# EasyEDA Pro project ProPrj_trevorschirmer-relayboard_2025-04-09.epro, board PCB_1
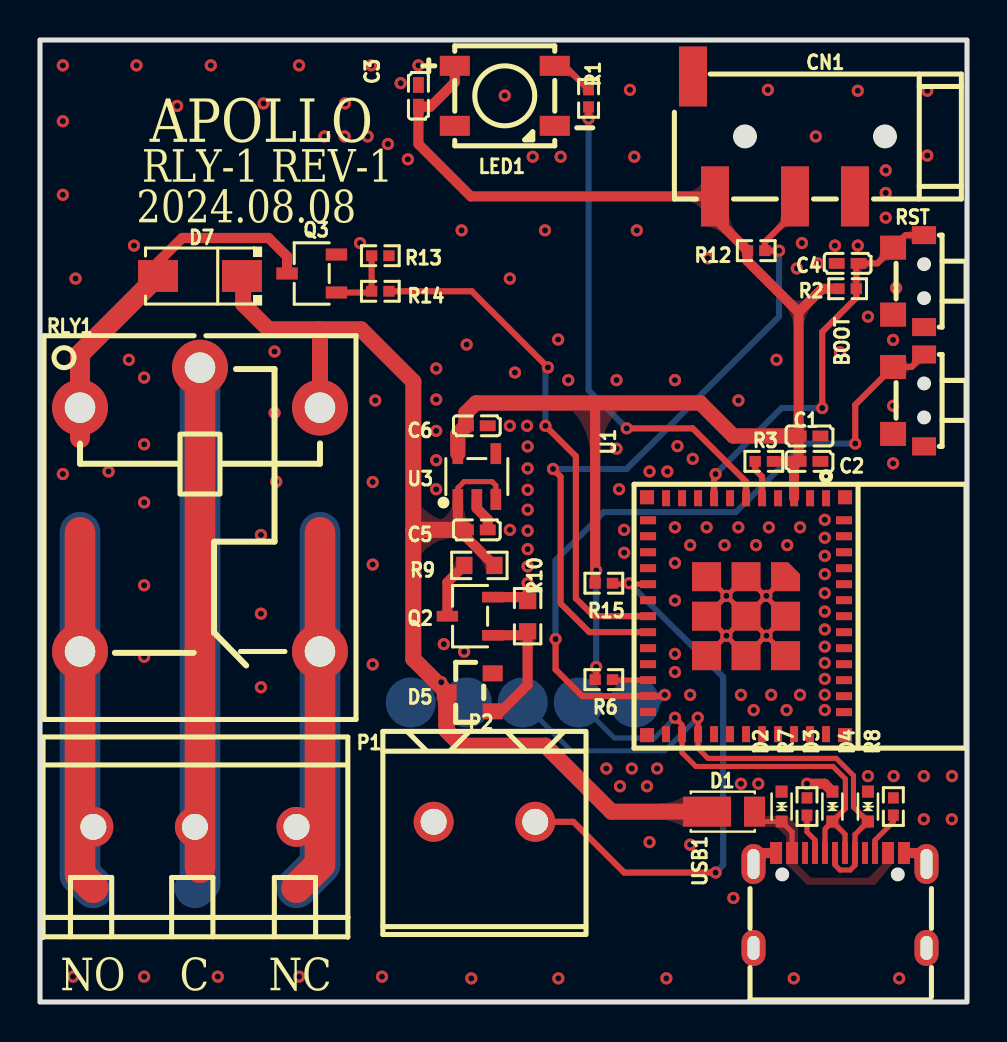
[diagram p10: board, top side]
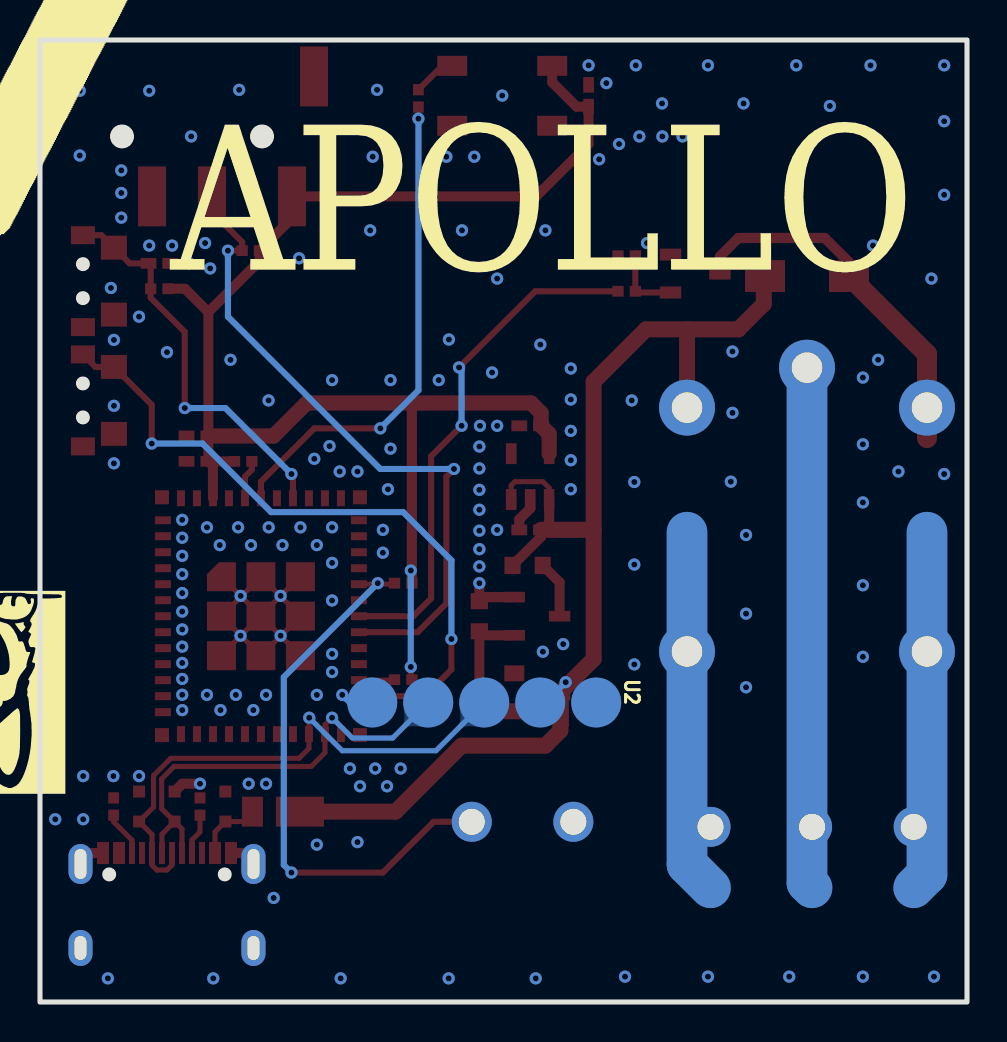
[diagram p11: board, bottom side, seen from below]

Outline 46.36 x 48.13 mm; copper layers: Top Layer, Bottom Layer. Coordinates in mm from the lower left corner of the outline.
Outline path: rectangle 0,48.13 46.36,0
Stack: Top Layer 0.035mm / Dielectric1 1.51mm FR4 er 4.5 / Bottom Layer 0.035mm

## Design rules (mm)
net IO_USBD-: DP1
net IO_USBD+: DP1
template: JLCPCB Capability(Two Layers Board)
spacing copperThickness1oz (default): track to track 0.102, other pairs 0.152 to 0.3
spacing copperThickness2oz: track to track 0.203, other pairs 0.152 to 0.3
track width copperThickness1oz (default): min 0.127, default 0.254, max 2.54
track width copperThickness2oz: min 0.203, default 0.254, max 2.54
differential pair differentialPair (default): width min 0.127, default 0.254, max 2.54; gap min 0.152, default 0.152
via viaSize (default): diameter min 0.5, default 0.61, max 10; hole min 0.3, default 0.305, max 6.3

## Placement (name value [footprint] x y rotation side)
BOOT  TS24CA  [SW-SMD_TS24CA]  43.43 30.1 270 top
C1  10uF  [C0402]  38.48 28.32 180 top
C2  100nF  [C0402]  38.48 27.05 0 top
C3  100nF  [C0402]  18.92 45.34 270 top
C4  1uF  [C0402]  40.39 36.96 0 top
C5  10uF  [C0402]  21.84 23.62 180 top
C6  10uF  [C0402]  21.84 28.83 180 top
CN1  PJ-320D  [AUDIO-SMD_PJ-320D]  36.7 43.31 270 top
D1  DFLS130L-7  [POWERDI-123_L2.8-W1.8-LS3.7-RD]  34.54 9.52 0 top
D2  LESD5D5.0CT1G  [SOD-523_L1.2-W0.8-LS1.6-BI]  37.08 9.78 90 top
D3  LESD5D5.0CT1G  [SOD-523_L1.2-W0.8-LS1.6-BI]  39.62 9.78 90 top
D4  LESD5D5.0CT1G  [SOD-523_L1.2-W0.8-LS1.6-BI]  41.4 9.78 90 top
D5  BZX84C6V8  [SOT-23_L2.9-W1.3-P1.90-LS2.4-BR]  21.49 15.49 0 top
D7  1N4007  [SMA_L4.3-W2.5-LS5.0-RD]  8 36.32 180 top
LED1  XL-5050RGBC-WS2812B  [LED-SMD_4P-L5.0-W5.0-BL_XL-5050RGBC]  23.24 45.34 270 top
P1  WJ500V-5.08-3P  [CONN-TH_3P-P5.00_WJ500V-5.08-3P]  7.75 8.76 0 top
P2  WJ500V-5.08-2P  [CONN-TH_2P-P5.00_WJ500V-5.08-2P]  22.23 9.02 180 top
Q2  BC817  [SOT-23-3_L2.9-W1.4-P1.91-LS2.6-BR]  21.51 19.3 0 top
Q3  S8050-J3Y  [SOT-23-3_L2.9-W1.6-P1.90-LS2.8-BR]  13.59 36.45 0 top
R1  470Ω  [R0402]  27.43 45.21 270 top
R2  10kΩ  [R0402]  40.39 35.69 180 top
R3  100kΩ  [R0402]  36.2 27.05 0 top
R6  10kΩ  [R0402]  28.19 16.13 180 top
R7  5.1kΩ  [R0402]  38.35 9.78 270 top
R8  5.1kΩ  [R0402]  42.67 9.78 270 top
R9  10K  [R0603]  21.97 21.84 0 top
R10  10K  [R0603]  24.38 19.3 270 top
R12  4.7kΩ  [R0402]  35.81 37.59 180 top
R13  470Ω  [R0402]  17.02 35.56 180 top
R14  10kΩ  [R0402]  17.02 37.34 180 top
R15  10kΩ  [R0402]  28.19 20.95 180 top
RLY1  SRD-05VDC-SL-C  [RELAY-TH_SRD-XXVDC-XL-C]  8 24.64 270 top
RST  TS24CA  [SW-SMD_TS24CA]  43.43 36.07 270 top
U1  ESP32-C3-MINI-1-N4  [WIFIM-SMD_ESP32-C3-MINI-1]  35.31 19.3 270 top
U2  -  [Programming Pads]  18.54 14.99 270 bottom
U3  RT9080-33GJ5  [TSOT-23-5_L2.9-W1.6-P0.95-LS2.8-BL]  21.84 26.29 0 top
USB1  TYPE-C16PIN2MD(073)  [USB-C-SMD_TYPE-C-6PIN-2MD-073]  40.01 5.08 0 top

## Footprints (pads in the part's own frame, mm; a bottom-side part is the same pattern mirrored in y, then rotated)
AUDIO-SMD_PJ-320D
  rect 3x1.4 smd: 1(-3,-4.05) 2(3,4.05) 3(3,1.05) 4(3,-2.95)
C0402
  rect 0.79x0.54 smd: 1(-0.545,0) 2(0.545,0)
CONN-TH_2P-P5.00_WJ500V-5.08-2P
  round 2 hole 1.3: 1(-2.54,0) 2(2.54,0)
CONN-TH_3P-P5.00_WJ500V-5.08-3P
  round 2 hole 1.3: 1(-5.08,0) 2(0,0) 3(5.08,0)
LED-SMD_4P-L5.0-W5.0-BL_XL-5050RGBC
  rect 1x1.5 smd: 1(-1.5,-2.5) 2(1.5,-2.5) 3(1.5,2.5) 4(-1.5,2.5)
POWERDI-123_L2.8-W1.8-LS3.7-RD
  rect 2.4x1.5 smd: 1(-1.188,0)
  rect 1.05x1.5 smd: 2(1.188,0)
Programming Pads
  round 2.5 smd: 1(0,0) 2(0,-2.8) 3(0,-5.6) 4(0,-8.4) 5(0,-11.2)
R0402
  rect 0.566x0.54 smd: 1(-0.433,0) 2(0.433,0)
R0603
  rect 0.806x0.864 smd: 1(-0.753,0) 2(0.753,0)
RELAY-TH_SRD-XXVDC-XL-C
  round 2.794 hole 1.524: 1(-5.1,-6) 2(7.1,-6) 3(7.1,6) 4(-5.1,6) 5(-7.1,0)
SMA_L4.3-W2.5-LS5.0-RD
  rect 2x1.593 smd: 1(-2.1,0) 2(2.1,0)
SOD-523_L1.2-W0.8-LS1.6-BI
  rect 0.6x0.6 smd: 1(-0.75,0) 2(0.75,0)
SOT-23-3_L2.9-W1.4-P1.91-LS2.6-BR
  rect 1.07x0.532 smd: 1(1.135,-0.955) 2(1.135,0.955) 3(-1.135,0)
SOT-23-3_L2.9-W1.6-P1.90-LS2.8-BR
  rect 1.07x0.6 smd: 1(1.235,-0.95) 2(1.235,0.95) 3(-1.235,0)
SOT-23_L2.9-W1.3-P1.90-LS2.4-BR
  rect 1x0.8 smd: 1(1.15,-0.95) 2(1.15,0.95) 3(-1.15,0)
SW-SMD_TS24CA
  rect 0.9x1.2 smd: 1(-2.3,0.775) 2(2.3,0.775)
  rect 1.2x1.3 smd: 3(-1.675,-0.775) 4(1.675,-0.775)
TSOT-23-5_L2.9-W1.6-P0.95-LS2.8-BL
  rect 0.532x1.045 smd: 1(-0.95,-1.147) 2(0,-1.147) 3(0.95,-1.147) 4(0.95,1.147) 5(-0.95,1.147)
USB-C-SMD_TYPE-C-6PIN-2MD-073
  rect 0.6x1.1 smd: 1(-3.2,2.375) 2(-2.4,2.375) 11(2.4,2.375) 12(3.2,2.375)
  rect 0.3x1.1 smd: 3(-1.75,2.375) 4(-1.25,2.375) 5(-0.75,2.375) 6(-0.25,2.375) 7(0.25,2.375) 8(0.75,2.375) 9(1.25,2.375) 10(1.75,2.375)
  oval 1.2x2 hole 0.6x1.5: 13(-4.325,1.825) 14(4.325,1.825)
  oval 1.2x1.8 hole 0.6x1.2: 13(-4.325,-2.375) 14(4.325,-2.375)
WIFIM-SMD_ESP32-C3-MINI-1
  rect 0.8x0.4 smd: 1(-5.9,4) 2(-5.9,3.2) 3(-5.9,2.4) 4(-5.9,1.6) 5(-5.9,0.8) 6(-5.9,0) 7(-5.9,-0.8) 8(-5.9,-1.6) 9(-5.9,-2.4) 10(-5.9,-3.2) 11(-5.9,-4) 25(5.9,-4) 26(5.9,-3.2) 27(5.9,-2.4) 28(5.9,-1.6) 29(5.9,-0.8) 30(5.9,0) 31(5.9,0.8) 32(5.9,1.6) 33(5.9,2.4) 34(5.9,3.2) 35(5.9,4)
  rect 0.4x0.8 smd: 12(-4.8,-4.9) 13(-4,-4.9) 14(-3.2,-4.9) 15(-2.4,-4.9) 16(-1.6,-4.9) 17(-0.8,-4.9) 18(0,-4.9) 19(0.8,-4.9) 20(1.6,-4.9) 21(2.4,-4.9) 22(3.2,-4.9) 23(4,-4.9) 24(4.8,-4.9) 36(4.8,4.9) 37(4,4.9) 38(3.2,4.9) 39(2.4,4.9) 40(1.6,4.9) 41(0.8,4.9) 42(0,4.9) 43(-0.8,4.9) 44(-1.6,4.9) 45(-2.4,4.9) 46(-3.2,4.9) 47(-4,4.9) 48(-4.8,4.9)
  custom 1.45x1.45 smd: 49(-1.975,1.975)
  rect 1.45x1.45 smd: 49(-1.975,0) 49(-1.975,-1.975) 49(0,1.975) 49(0,0) 49(0,-1.975) 49(1.975,1.975) 49(1.975,0) 49(1.975,-1.975)
  rect 0.7x0.7 smd: 50(5.95,4.95) 51(5.95,-4.95) 52(-5.95,-4.95) 53(-5.95,4.95)

## Nets
As in the schematic.

Pads without a net: BOOT 2; CN1 1; D5 2; LED1 2; RST 2; U1 4 7 9 10 12 13 15 17 20 21 24 25 28 29 30 31 32 33 34 35; U3 4; USB1 3 9

## Via types
v1: diameter 0.61, hole 0.305, Top Layer to Bottom Layer, 181 vias

## Routing (per net, layer and track width the routed paths; a pad name or vN(x,y) marks a point on that pad's centre or on a via; arc(x,y) is an arc through that point)
+3V3: length 76.6
  Top Layer w0.305: R6.2 27.81,16.18 v1(27.81,16.76) ; R15.2 27.81,21.01 v1(27.81,21.59)
  Top Layer w0.5: U1.3 37.71,26.82 C2.1 ; R3.2 C2.1 ; C2.1 C1.2 37.94,34.52 ; LED1.1 20.74,46.01 19.52,44.79 C3.2 18.92,42.93 21.54,40.31 CN1.4 33.75,39.22 R12.2 35.38,37.07 37.94,34.52 ; 37.94,34.52 39.11,35.69 R2.2
  Top Layer w0.508: R15.2 27.76,29.86 27.65,29.97
  Top Layer w0.762: 20.89,27.44 20.89,28.42 C6.2 21.3,29.47 21.8,29.97 33.02,29.97 34.67,28.32 C1.2
  Bottom Layer w0.305: v1(27.81,21.59) v1(27.81,16.76)
+5V_USB: length 62.6
  Top Layer w0.254: U3.3 22.79,25.85 22.61,26.03 21.21,26.03 20.89,25.72 20.89,25.14
  Top Layer w0.305: v1(20.07,16) 20.07,13.84 20.34,13.57
  Top Layer w0.5: R9.2 21.3,23.27 C5.2 ; 20.79,23.62 20.89,23.73 20.89,25.14
  Top Layer w0.8: 10.16,36.19 10.16,34.92 11.43,33.66 13.95,33.66 ; C5.2 18.67,23.62 ; 18.67,23.62 18.67,31.04 16.05,33.66 13.95,33.66 ; 18.67,23.62 18.67,17.16 D5.3 20.34,13.57 21.08,12.83 25.27,12.83 28.58,9.52 D1.1 ; RLY1.4 14,33.6 13.95,33.66 ; 10.16,36.26 D7.1
  Top Layer w1: 10.16,36.19 10.16,36.32
  Bottom Layer w0.305: U2.2 21.08,14.99 v1(20.07,16)
GND: length 31
  Top Layer w0.254: U1.49 34.32,18.32 ; U1.49 35.32,19.32 ; U1.49 35.31,19.34 ; 34.32,18.32 U1.49 ; 34.32,18.32 U1.49 36.31,18.33 ; 34.32,18.32 U1.49 34.32,20.3 v1(34.32,20.32) ; 36.29,20.29 v1(36.32,20.32) 37.28,21.28 ; 36.29,20.29 35.32,19.32 ; 36.29,20.29 35.31,21.28 34.35,20.32 v1(34.32,20.32) ; 36.29,20.29 U1.49 36.31,18.33 ; 33.33,21.28 33.36,21.28 v1(34.32,20.32) ; 36.31,18.33 37.28,17.36 U1.49 ; 36.31,18.33 35.32,19.32 ; v1(34.32,20.32) 35.31,19.34 ; 35.32,19.32 35.31,19.34
  Top Layer w0.508: USB1.14 43.78,7.45 USB1.12 ; C5.1 22.39,24.15 21.84,24.69 U3.2 ; 22.64,20.26 24.18,20.26 R10.1 v1(24.38,20.95) ; USB1.13 36.23,7.45 USB1.1 ; D3.2 39.23,10.92 v1(38.35,10.92)
  vias: v1(1.14,46.86) v1(1.14,44.07) v1(1.14,40.39) v1(1.14,26.42) v1(1.65,1.27) v1(1.78,36.19) v1(3.43,26.54) v1(4.45,32.13) v1(4.7,37.85) v1(4.83,46.86) v1(5.21,31.24) v1(5.21,27.91) v1(5.21,24.99) v1(5.21,20.85) v1(5.21,17.27) v1(5.21,1.27) v1(6.86,44.83) v1(8.54,46.86) v1(8.89,1.27) v1(11.05,23.37) v1(11.05,19.43) v1(11.05,15.75) v1(11.18,44.96) v1(11.73,32.55) v1(11.73,29.48) v1(11.81,26.03) v1(12.95,46.86) v1(12.95,1.27) v1(14.22,43.31) v1(15.25,44.96) v1(15.23,43.31) v1(16,37.97) v1(16.38,43.31) v1(16.56,46.86) v1(16.64,26.02) v1(16.64,21.89) v1(16.64,16.89) v1(16.76,30.1) v1(17.1,1.27) v1(17.4,42.93) v1(18.03,45.97) v1(18.4,42.16) v1(18.92,46.86) v1(19.81,31.7) v1(19.81,30.15) v1(19.81,28.57) v1(19.81,27.11) v1(19.81,25.65) v1(20.19,17.91) v1(21.08,38.61) v1(21.21,17.53) v1(21.34,32.89) v1(21.57,1.18) v1(23.24,45.35) v1(23.49,36.19) v1(23.49,28.83) v1(23.49,23.62) v1(23.75,31.5) v1(24.35,28.83) v1(24.38,27.79) v1(24.38,26.7) v1(24.38,25.63) v1(24.38,24.63) v1(24.38,23.58) v1(24.38,22.66) v1(24.38,21.8) v1(24.64,42.29) v1(25.25,38.61) v1(25.91,33.15) v1(25.92,1.18) v1(26.04,42.29) v1(26.42,31.11) v1(28.32,11.68) v1(28.83,31.11) v1(28.83,27.69) v1(28.96,25.65) v1(29,10.79) v1(29.21,23.62) v1(29.21,22.48) v1(29.5,45.64) v1(29.59,11.68) v1(29.72,42.29) v1(29.85,38.61) v1(30.35,10.79) v1(30.48,26.54) v1(30.48,8) v1(30.86,11.68) v1(31.37,26.54) v1(31.32,1.18) v1(31.75,31.11) v1(31.75,23.75) v1(31.75,21.97) v1(31.75,20.09) v1(31.75,17.42) v1(31.75,16.51) v1(31.88,27.81) v1(32.51,22.86) v1(32.51,15.37) v1(32.51,7.87) v1(32.64,27.18) v1(33.33,23.75) v1(33.4,37.21) v1(34.23,22.86) v1(34.32,18.33) v1(34.67,5.21) v1(34.92,30.1) v1(34.92,23.75) v1(35.05,15.37) v1(35.05,10.92) v1(35.69,14.6) v1(35.8,22.86) v1(35.92,10.92) v1(36.33,18.33) v1(36.4,45.64) v1(36.45,23.75) v1(36.56,15.37) v1(36.83,32.13) v1(37.37,22.86) v1(37.33,14.6) v1(37.69,1.18) v1(37.85,36.7) v1(38.01,23.75) v1(38.01,15.37) v1(38.1,37.97) v1(38.8,43.31) v1(38.9,36.96) v1(39.24,24.13) v1(39.24,23.23) v1(39.24,22.32) v1(39.24,21.41) v1(39.24,20.46) v1(39.24,19.54) v1(39.24,18.64) v1(39.24,17.78) v1(39.24,16.97) v1(39.24,16.17) v1(39.24,15.37) v1(39.24,14.6) v1(39.75,37.85) v1(40.01,32.51) v1(40.89,45.59) v1(40.89,37.85) v1(41.4,34.29) v1(41.4,11.3) v1(42.29,41.61) v1(42.29,40.48) v1(42.29,39.24) v1(42.66,33.13) v1(42.66,29.83) v1(42.66,26.95) v1(42.69,11.3) v1(42.81,35.73) v1(42.96,1.18) v1(44.2,11.3) v1(44.2,9.14) v1(44.37,45.59) v1(44.37,42.35) v1(45.6,11.3) v1(45.59,9.14)
CHIP_PU: length 19.8
  Top Layer w0.305: v1(33.78,26.42) 33.71,26.34 U1.8 ; RST.1 43.28,38.37 RST.3 41.87,36.96 C4.2 40.82,36.84 R2.1 40.82,35.23 39.12,33.53 v1(39.12,29.72)
  Bottom Layer w0.305: v1(33.78,26.42) 37.08,29.72 v1(39.12,29.72)
COM: length 51.1
  Top Layer w1.524: RLY1.5 8,6.72
  Bottom Layer w2.032: 7.75,5.71 8,5.97 RLY1.5
IO_4_RELAY: length 25.7
  Top Layer w0.305: v1(25.4,31.75) 21.59,35.56 R13.1 ; U1.18 27.69,19.3 26.8,20.19 26.8,27.3 v1(25.27,28.83)
  Bottom Layer w0.305: v1(25.27,28.83) 25.27,31.62 v1(25.4,31.75)
IO_5_TEMP: length 33.7
  Top Layer w0.305: v1(25.65,26.67) 26.04,26.29 26.04,19.94 27.47,18.5 U1.19 ; CN1.3 37.75,39.53 36.25,38.02 R12.1 v1(36.96,37.59)
  Bottom Layer w0.305: v1(36.96,37.59) 36.96,34.29 29.34,26.67 v1(25.65,26.67)
IO_10_LIMIT: length 28.5
  Top Layer w0.254: 29.39,20.9 28.68,20.9 R15.1 ; U1.16 29.41,20.9
  Top Layer w0.305: v1(33.78,6.48) 29.21,6.48 26.67,9.02 P2.1 ; v1(29.46,20.95) 29.41,20.9 29.39,20.9
  Bottom Layer w0.305: v1(33.78,6.48) 34.16,6.86 34.16,16.26 v1(29.46,20.95)
IO_BTN1: length 37
  Top Layer w0.305: v1(31.24,15.37) 31.18,15.3 U1.23 27.11,15.3 25.78,16.64 v1(25.78,18.16) ; 44.21,32.4 43.58,31.77 BOOT.3 40.77,29.88 v1(40.77,27.94)
  Bottom Layer w0.305: v1(31.24,15.37) 30.86,14.99 U2.5 ; v1(40.77,27.94) 38.23,27.94 34.8,24.51 28.19,24.51 25.78,22.1 v1(25.78,18.16)
IO_LED: length 24.8
  Top Layer w0.305: U1.6 35.31,26.03 32.64,28.7 v1(29.34,28.7) ; v1(27.43,44.2) 27.43,44.78
  Bottom Layer w0.305: v1(27.43,44.2) 27.43,30.61 v1(29.34,28.7)
IO_USBD+: length 27.2
  Top Layer w0.254: v1(32.89,14.22) 32.91,14.21 U1.27 32.91,12.69 33.4,12.19 39.82,12.19 40.68,11.33 40.68,9.75 D4.1 40.76,8.38 USB1.8 40.76,6.85 40.51,6.6 40.01,6.6 39.76,6.85 USB1.6
  Bottom Layer w0.254: v1(32.89,14.22) 31.24,12.57 26.55,12.57 U2.3
IO_USBD-: length 22.5
  Top Layer w0.254: USB1.7 40.26,8.4 D3.1 ; v1(31.75,14.22) 32.11,13.87 U1.26 32.11,12.47 32.8,11.79 39.65,11.79 40.27,11.16 40.27,9.68 D3.1 ; D3.1 39.26,8.66 USB1.5
  Bottom Layer w0.254: v1(31.75,14.22) 30.73,13.21 28.72,13.21 U2.4
NC: length 36.6
  Top Layer w1.524: 12.83,5.71 14,6.89 14,23.51
  Bottom Layer w2.032: 12.83,5.71 14,6.89 14,23.51
NO: length 36.1
  Top Layer w1.524: 2,23.51 2,6.38 2.67,5.71
  Bottom Layer w2.032: 2.67,5.71 2,6.38 2,23.51
$1N1788: length 2.1
  Top Layer w0.254: USB1.4 38.76,8.11 38.35,8.51 R7.2
$1N1789: length 2.3
  Top Layer w0.254: USB1.10 41.76,8.1 42.67,9.02 R8.2
$1N1792: length 2.9
  Top Layer w0.5: R9.1 20.37,21 Q2.3
$1N1794: length 6.8
  Top Layer w0.5: Q2.1 24.18,18.35 R10.2 24.38,15.88 23.05,14.54 D5.1
$1N1815: length 1.8
  Top Layer w0.254: U1.22 28.65,16.1 R6.1
$1N1837: length 2.2
  Top Layer w0.305: R1.1 26.24,46.84 LED1.4
$1N1851: length 2
  Top Layer w0.305: 35.76,27.05 35.76,26.63 36.11,26.28 U1.5
$1N1854: length 3.5
  Top Layer w0.254: USB1.2 37.61,8.51 D2.1 35.95,9.03 35.73,9.25 D1.2
$2N930: length 3.6
  Top Layer w0.305: R14.2 R13.2 16.52,35.5 Q3.1
$2N1031: length 18.6
  Top Layer w0.508: D7.2 5.9,37.02 7.11,38.23 11.43,38.23 12.35,37.3 Q3.3
  Top Layer w1: D7.2 2,32.42 RLY1.1 2,28.21

## Copper pours and planes (outline as drawn; the poured copper is in the pictures)
GND on Top Layer: -1.02,49.4 47.12,49.4 47.24,49.28 47.24,-1.4 47.12,-1.52 -1.14,-1.52 -1.14,49.28
GND on Bottom Layer: -0.89,49.02 47.24,49.02 47.24,-1.52 -1.02,-1.52 -1.14,-1.4 -1.14,48.77
$1N1854 on Top Layer: 35.24,10.23 42.67,10.23 42.67,5.86 35.24,5.86

Small or netless copper shapes (teardrops, artwork), in the pictures only: 95 on Top Layer, 16 on Bottom Layer

## Text on the board
Bottom Silkscreen Layer: APOLLO
Top Silkscreen Layer: NO | 2024.08.08 | RLY-1 REV-1 | C | NC | APOLLO
